# Altium schematic sheet Sheet3.SchDoc
size 508 x 241 mm; SheetNumber: 4; SheetTotal: 4
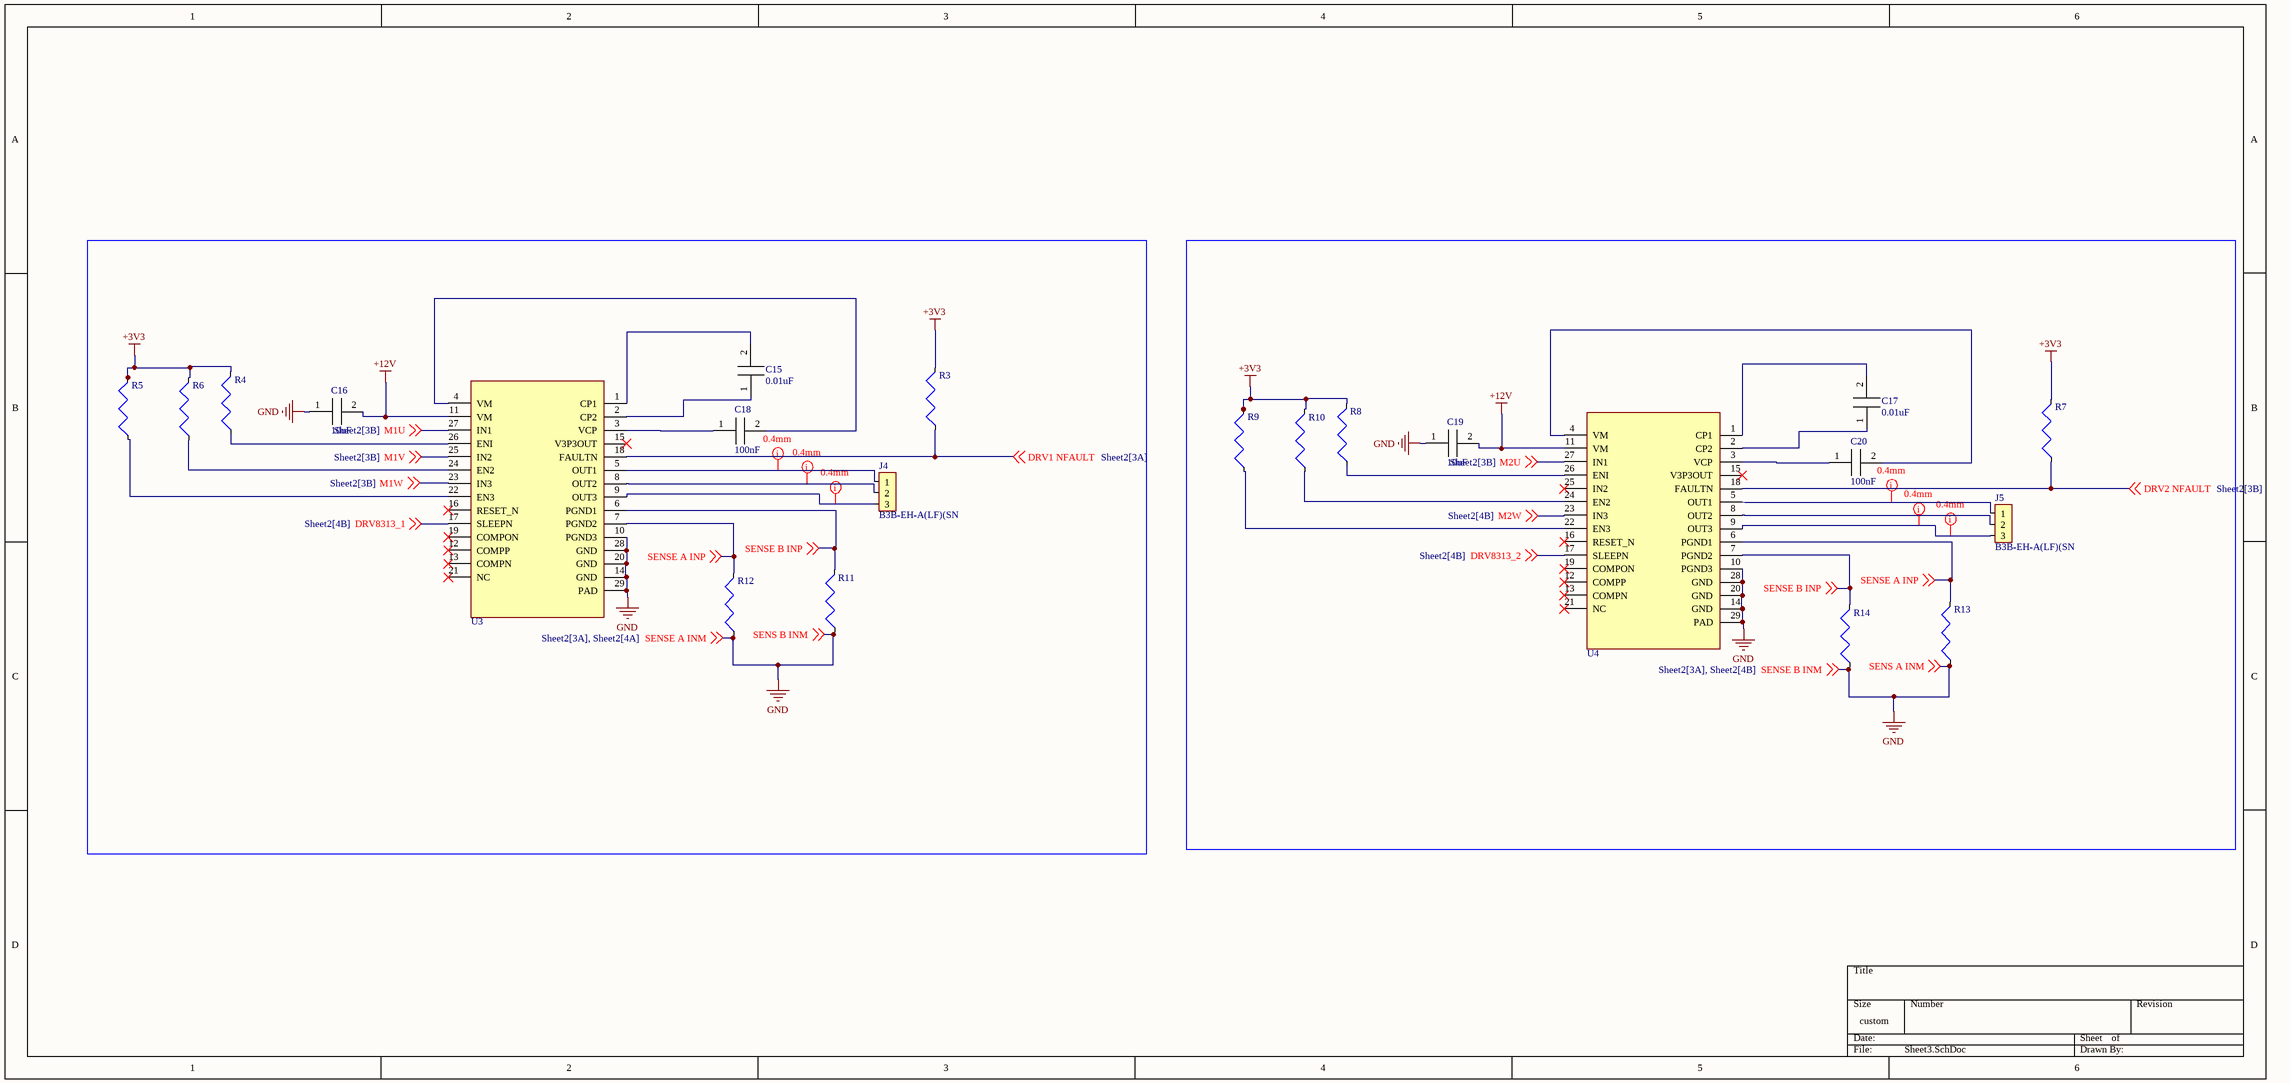
[diagram p0: Sheet3.SchDoc]

## Parts
C15  value 0.01uF  [capacitor]  (hidden comment: capacitor symbol)
C16  value 10uF  [capacitor]  (hidden comment: capacitor symbol)
C17  value 0.01uF  [capacitor]  (hidden comment: capacitor symbol)
C18  value 100nF  [capacitor]  (hidden comment: capacitor symbol)
C19  value 10uF  [capacitor]  (hidden comment: capacitor symbol)
C20  value 100nF  [capacitor]  (hidden comment: capacitor symbol)
J4  B3B-EH-A(LF)(SN  [3 pin header]
J5  B3B-EH-A(LF)(SN  [3 pin header]
R3  Resistor 1206  [Resistor]  (value not drawn)
R4  Resistor 1206  [Resistor]  (value not drawn)
R5  Resistor 1206  [Resistor]  (value not drawn)
R6  Resistor 1206  [Resistor]  (value not drawn)
R7  Resistor 1206  [Resistor]  (value not drawn)
R8  Resistor 1206  [Resistor]  (value not drawn)
R9  Resistor 1206  [Resistor]  (value not drawn)
R10  Resistor 1206  [Resistor]  (value not drawn)
R11  Resistor 1206  [Resistor]  (value not drawn)
R12  Resistor 1206  [Resistor]  (value not drawn)
R13  Resistor 1206  [Resistor]  (value not drawn)
R14  Resistor 1206  [Resistor]  (value not drawn)
U3  U  [DRV8313PWP]  (value not drawn)
U4  U  [DRV8313PWP]  (value not drawn)

## Nets
+3V3: R3.2 R4.2 R5.2 R6.2 R7.2 R8.2 R9.2 R10.2
+12V: C16.2 C19.2 U3.11(VM) U4.11(VM)
GND: C16.1 C19.1 R11.1 R12.1 R13.1 R14.1 U3.10(PGND3) U3.14(GND) U3.20(GND) U3.28(GND) U3.29(PAD) U4.10(PGND3) U4.14(GND) U4.20(GND) U4.28(GND) U4.29(PAD) ; off-sheet SENSE A INM, off-sheet SENS B INM, off-sheet SENSE B INM, off-sheet SENS A INM  [also labelled SENS A INM, SENS B INM, SENSE A INM, SENSE B INM]
DRV1 NFAULT: R3.1 U3.18(FAULTN) ; off-sheet DRV1 NFAULT
DRV2 NFAULT: R7.1 U4.18(FAULTN) ; off-sheet DRV2 NFAULT
DRV8313_1: U3.17(SLEEPN) ; off-sheet DRV8313_1
DRV8313_2: U4.17(SLEEPN) ; off-sheet DRV8313_2
M1U: U3.27(IN1) ; off-sheet M1U
M1V: U3.25(IN2) ; off-sheet M1V
M1W: U3.23(IN3) ; off-sheet M1W
M2U: U4.27(IN1) ; off-sheet M2U
M2W: U4.23(IN3) ; off-sheet M2W
SENSE A INP: R12.2 R13.2 U3.7(PGND2) U4.6(PGND1) ; off-sheet SENSE A INP
SENSE B INP: R11.2 R14.2 U3.6(PGND1) U4.7(PGND2) ; off-sheet SENSE B INP
NetC15_1: C15.1 U3.2(CP2)
NetC15_2: C15.2 U3.1(CP1)
NetC17_1: C17.1 U4.2(CP2)
NetC17_2: C17.2 U4.1(CP1)
NetC18_1: C18.1 U3.3(VCP)
NetC18_2: C18.2 U3.4(VM)
NetC20_1: C20.1 U4.3(VCP)
NetC20_2: C20.2 U4.4(VM)
NetJ4_1: J4.1 U3.5(OUT1)
NetJ4_2: J4.2 U3.8(OUT2)
NetJ4_3: J4.3 U3.9(OUT3)
NetJ5_1: J5.1 U4.5(OUT1)
NetJ5_2: J5.2 U4.8(OUT2)
NetJ5_3: J5.3 U4.9(OUT3)
NetR4_1: R4.1 U3.26(ENI)
NetR5_1: R5.1 U3.22(EN3)
NetR6_1: R6.1 U3.24(EN2)
NetR8_1: R8.1 U4.26(ENI)
NetR9_1: R9.1 U4.22(EN3)
NetR10_1: R10.1 U4.24(EN2)

Not connected (* = marked no-connect by the designer): U3 12(COMPP)* 13(COMPN)* 15(V3P3OUT)* 16(RESET_N)* 19(COMPON)* 21(NC)*; U4 12(COMPP)* 13(COMPN)* 15(V3P3OUT)* 16(RESET_N)* 19(COMPON)* 21(NC)* 25(IN2)*

## Layout directives
mark named 0.4mm: NetJ4_1, NetJ4_2, NetJ4_3, NetJ5_1, NetJ5_3

## Library data of the parts
J4 J5 = 3 pin header
R3-R14 = Resistor 1206: Manuf: YAGEO; Mfr. Part #: RC1206FR-0710KL; Seller Part #: C132649; Seller: LCSC; Package: 1206
U3 U4 = DRV8313PWP